# Altium schematic sheet starfish_2.SchDoc: starfish
size 282 x 208 mm; Origin: Eagle; Date: 4/18/2022 11:53:22 PM; SheetNumber: 3; GateName_1: G$1; SymbolName_1: A4L-LOC; LibraryName: frames; DeviceSetName: A4L-LOC; Sheet: Sheet:
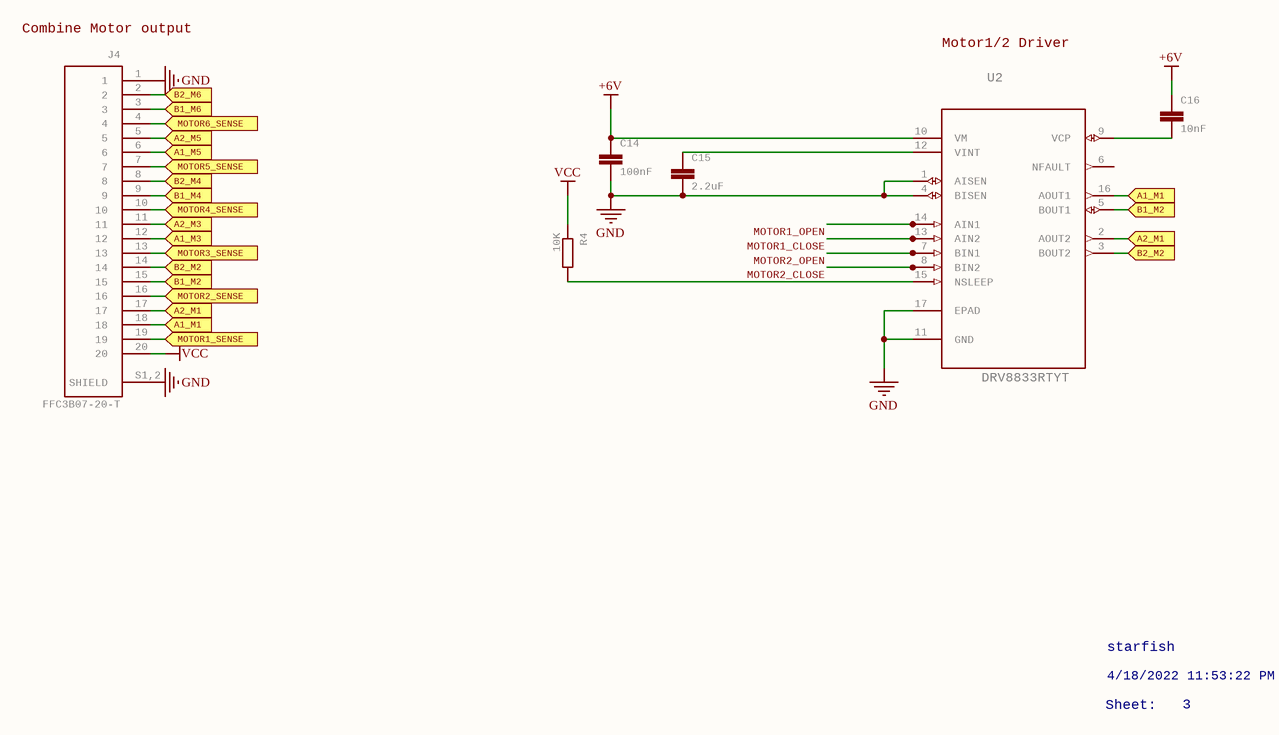
[diagram p0: starfish_2.SchDoc]

## Parts
C14  100nF  [C0603]
C15  2.2uF  [C0603]
C16  10nF  [C0603]
J4  FFC3B07-20-T  [GCT_FFC3B07-20-T]
R4  10K  [R0603]
U2  DRV8833RTYT  [QFN65P400X400X80-17N]

## Ports
A1_M1 (in), A1_M3 (in), A1_M5 (in), A2_M1 (in), A2_M3 (in), A2_M5 (in), B1_M2 (in), B1_M4 (in), B1_M6 (in), B2_M2 (in), B2_M4 (in), B2_M6 (in), MOTOR1_SENSE (in), MOTOR2_SENSE (in), MOTOR3_SENSE (in), MOTOR4_SENSE (in), MOTOR5_SENSE (in), MOTOR6_SENSE (in)

## Nets
+6V: C14.1 C16.1 U2.10(VM)
GND: C14.2 C15.2 J4.1 J4.S1,2(SHIELD) U2.1(AISEN) U2.4(BISEN) U2.11(GND) U2.17(EPAD)
VCC: J4.20 R4.1
A1_M1: J4.18 U2.16(AOUT1) ; port A1_M1
A1_M3: J4.12 ; port A1_M3
A1_M5: J4.6 ; port A1_M5
A2_M1: J4.17 U2.2(AOUT2) ; port A2_M1
A2_M3: J4.11 ; port A2_M3
A2_M5: J4.5 ; port A2_M5
B1_M2: J4.15 U2.5(BOUT1) ; port B1_M2
B1_M4: J4.9 ; port B1_M4
B1_M6: J4.3 ; port B1_M6
B2_M2: J4.14 U2.3(BOUT2) ; port B2_M2
B2_M4: J4.8 ; port B2_M4
B2_M6: J4.2 ; port B2_M6
MOTOR1_CLOSE: U2.13(AIN2)
MOTOR1_OPEN: U2.14(AIN1)
MOTOR1_SENSE: J4.19 ; port MOTOR1_SENSE
MOTOR2_CLOSE: U2.8(BIN2)
MOTOR2_OPEN: U2.7(BIN1)
MOTOR2_SENSE: J4.16 ; port MOTOR2_SENSE
MOTOR3_SENSE: J4.13 ; port MOTOR3_SENSE
MOTOR4_SENSE: J4.10 ; port MOTOR4_SENSE
MOTOR5_SENSE: J4.7 ; port MOTOR5_SENSE
MOTOR6_SENSE: J4.4 ; port MOTOR6_SENSE
NetC15_1: C15.1 U2.12(VINT)
NetC16_2: C16.2 U2.9(VCP)
NetR4_2: R4.2 U2.15(NSLEEP)

Not connected (* = marked no-connect by the designer): U2 6(NFAULT)

## Notes on the sheet
- (near J4) Combine Motor output
- Motor1/2 Driver
- starfish
- Sheet:
- 4/18/2022 11:53:22 PM
- 3

## Library data of the parts
C14-C16 = C-EUC0603: CAPACITOR, European symbol; GateName_1: G$1; SymbolName_1: C-EU; DeviceName: C0603; LibraryName: resistor; DeviceSetName: C-EU
J4 = FFC3B07-20-T: FPC 1.0mm Pitch, Side entry, Top contact, SMT, Height 2.5mm, Slide type Check availability; GateName_1: G$1; DESCRIPTION: 20 Position FFC, FPC Connector Contacts, Bottom 0.039 (1.00mm) Surface Mount, Right Angle; MF: Global Connector Technology; SymbolName_1: FFC3B07-20-T; LibraryName: FFC3B07-20-T; DeviceSetName: FFC3B07-20-T; AVAILABILITY: In Stock; MP: FFC3B07-20-T; PACKAGE: None; PRICE: None; PURCHASE-URL: https://pricing.snapeda.com/search/part/FFC3B07-20-T/?ref=eda
R4 = R-EU_R0603: RESISTOR, European symbol; GateName_1: G$1; SymbolName_1: R-EU; DeviceSetName: R-EU_; DeviceName: R0603; LibraryName: resistor
U2 = DRV8833RTYT: DUAL H-BRIDGE MOTOR DRIVER,QFN-16; GateName_1: A; SymbolName_1: DRV8833RTYT; LibraryName: DRV8833RTYT; DeviceSetName: DRV8833RTYT; MPN: DRV8833RTYT; OC_FARNELL: 2057087; OC_NEWARK: 64T2942; PACKAGE: QFN-16; SUPPLIER: TEXAS INSTRUMENTS